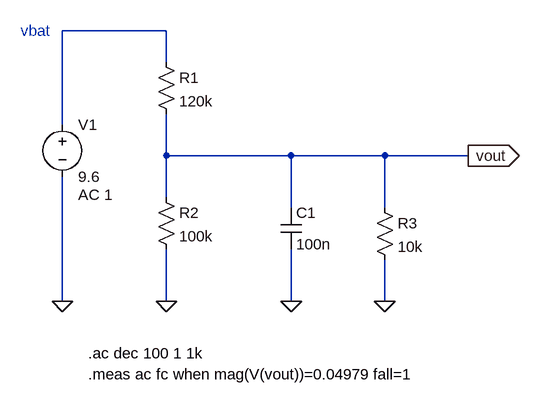
[diagram p0: schematic 06_ac.asc]
06_ac.asc, the LTspice schematic file:
Version 4.1
SHEET 1 968 680
WIRE 336 -80 176 -80
WIRE 336 -32 336 -80
WIRE 176 64 176 -80
WIRE 336 112 336 48
WIRE 528 112 336 112
WIRE 672 112 528 112
WIRE 800 112 672 112
WIRE 336 176 336 112
WIRE 528 192 528 112
WIRE 672 192 672 112
WIRE 176 336 176 144
WIRE 336 336 336 256
WIRE 528 336 528 256
WIRE 672 336 672 272
FLAG 336 336 0
FLAG 176 336 0
FLAG 528 336 0
FLAG 800 112 vout
IOPIN 800 112 Out
FLAG 672 336 0
SYMBOL voltage 176 48 R0
WINDOW 123 24 124 Left 2
WINDOW 39 0 0 Left 0
SYMATTR Value2 AC 1
SYMATTR InstName V1
SYMATTR Value 9.6
SYMBOL res 320 -48 R0
SYMATTR InstName R1
SYMATTR Value 120k
SYMBOL res 320 160 R0
SYMATTR InstName R2
SYMATTR Value 100k
SYMBOL cap 512 192 R0
SYMATTR InstName C1
SYMATTR Value 100n
SYMBOL res 656 176 R0
SYMATTR InstName R3
SYMATTR Value 10k
TEXT 112 -80 Left 2 ;vbat
TEXT 216 416 Left 2 !.ac dec 100 1 1k
TEXT 216 448 Left 2 !.meas ac fc when mag(V(vout))=0.04979 fall=1

The netlist it stands for:
* 06_ac.asc
V1 N001 0 9.6 AC 1
R1 N001 vout 120k
R2 vout 0 100k
C1 vout 0 100n
R3 vout 0 10k
* vbat
.ac dec 100 1 1k
.meas ac fc when mag(V(vout))=0.04979 fall=1
.backanno
.end